# Altium schematic sheet 01_KOM_ACB23_4009_Overview.SchDoc: Overview
size A4; DocumentNumber: 2023-03-28; Revision: v0.11; SheetNumber: 1; SheetTotal: 9
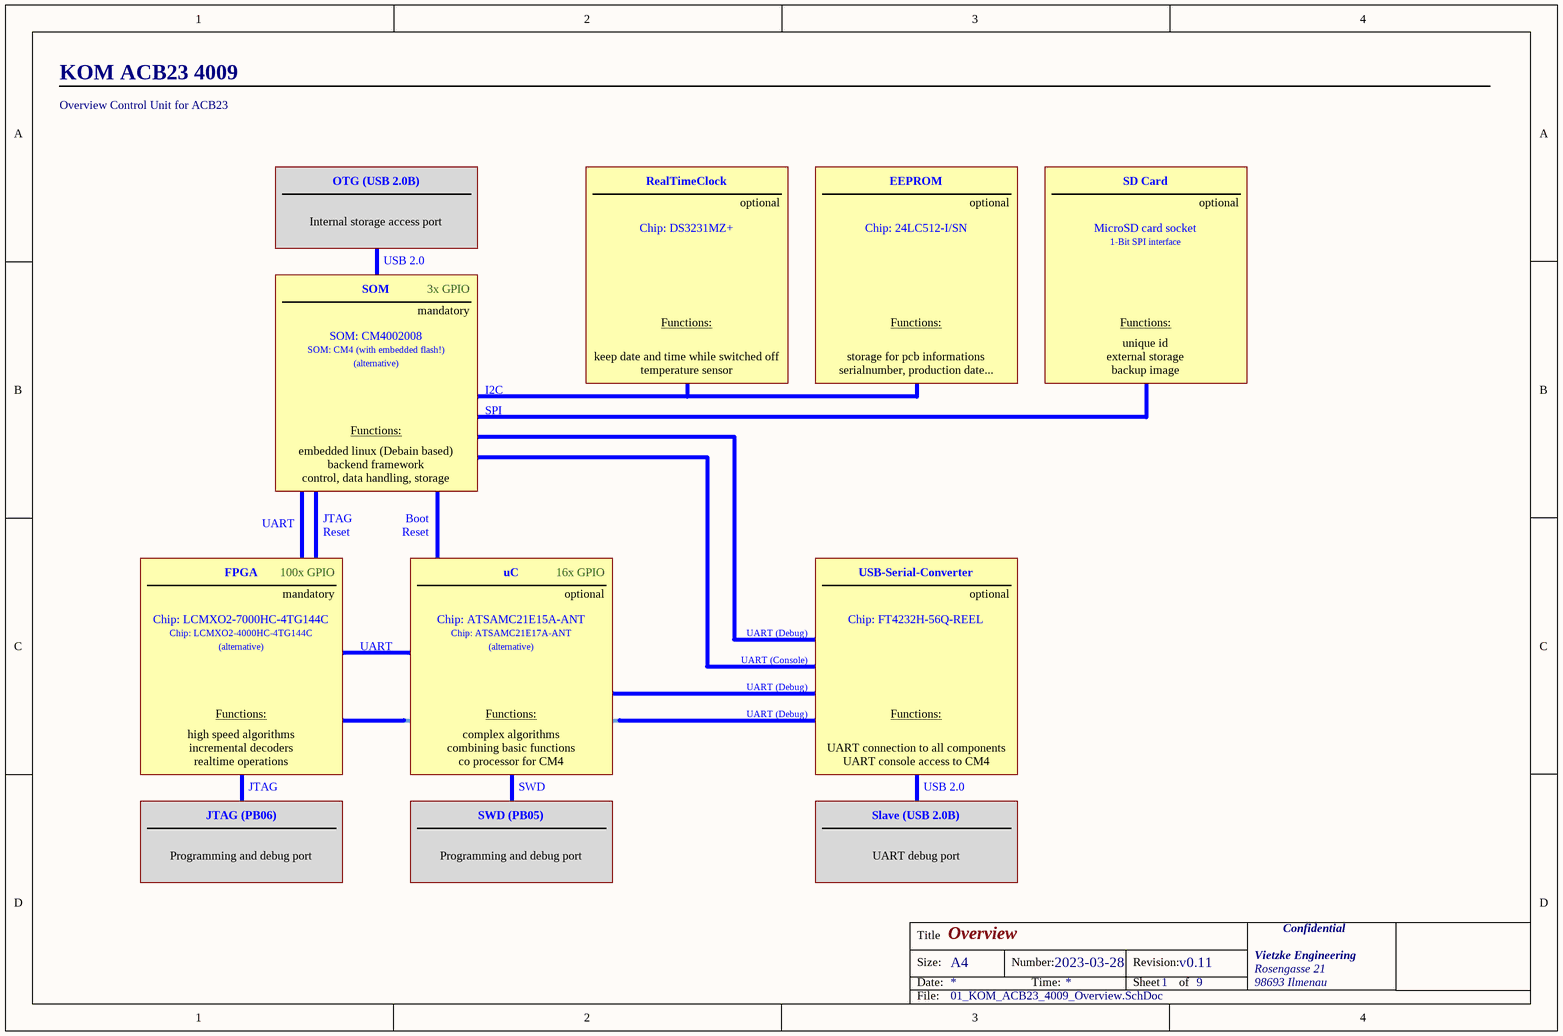
[diagram p0: 01_KOM_ACB23_4009_Overview.SchDoc]

## Notes on the sheet
- KOM ACB23 4009
- Overview Control Unit for ACB23
- OTG (USB 2.0B)
- RealTimeClock
- EEPROM
- SD Card
- Internal storage access port
- Chip: DS3231MZ+
- optional
- Chip: 24LC512-I/SN
- MicroSD card socket
- 1-Bit SPI interface
- SOM
- USB 2.0
- mandatory
- 3x GPIO
- SOM: CM4002008
- SOM: CM4 (with embedded flash!)
- (alternative)
- I2C
- keep date and time while switched off
- Functions:
- temperature sensor
- storage for pcb informations
- serialnumber, production date...
- backup image
- external storage
- unique id
- embedded linux (Debain based)
- SPI
- JTAG
- control, data handling, storage
- backend framework
- Boot
- FPGA
- UART
- Reset
- 100x GPIO
- uC
- 16x GPIO
- USB-Serial-Converter
- Chip: LCMXO2-7000HC-4TG144C
- Chip: LCMXO2-4000HC-4TG144C
- Chip: ATSAMC21E15A-ANT
- Chip: ATSAMC21E17A-ANT
- UART (Debug)
- UART (Console)
- Chip: FT4232H-56Q-REEL
- realtime operations
- incremental decoders
- high speed algorithms
- co processor for CM4
- combining basic functions
- complex algorithms
- SWD
- UART console access to CM4
- UART connection to all components
- JTAG (PB06)
- Programming and debug port
- SWD (PB05)
- Slave (USB 2.0B)
- UART debug port
- Title
- Size:
- Date:
- A4
- Number:
- Time:
- Revision:
- Sheet
- of
- Vietzke Engineering
- Rosengasse 21
- 98693 Ilmenau
- Confidential
- File: